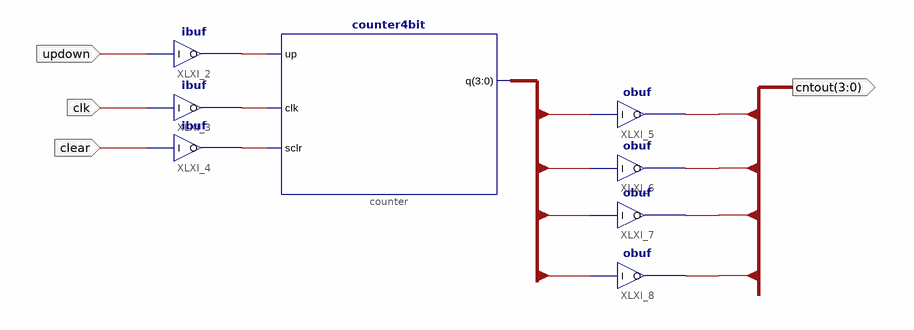
[diagram p0: schematic sheet 1]
// Xilinx ISE schematic lab2_1.sch (spartan3) as structural Verilog: 8 symbols, 4 ports
module lab2_1 (
  input  updown,
  input  clk,
  input  clear,
  output [3:0] cntout
);

  wire XLXN_1, XLXN_2, XLXN_3;
  wire [3:0] q;

  counter4bit counter (.up(XLXN_1), .clk(XLXN_2), .sclr(XLXN_3), .q(q));
  ibuf XLXI_2 (.I(updown), .O(XLXN_1));
  ibuf XLXI_3 (.I(clk), .O(XLXN_2));
  ibuf XLXI_4 (.I(clear), .O(XLXN_3));
  obuf XLXI_5 (.I(q[0]), .O(cntout[0]));
  obuf XLXI_6 (.I(q[1]), .O(cntout[1]));
  obuf XLXI_7 (.I(q[2]), .O(cntout[2]));
  obuf XLXI_8 (.I(q[3]), .O(cntout[3]));
endmodule
